# Altium schematic sheet PLL.SchDoc
size B; SheetNumber: 6; SheetTotal: 8
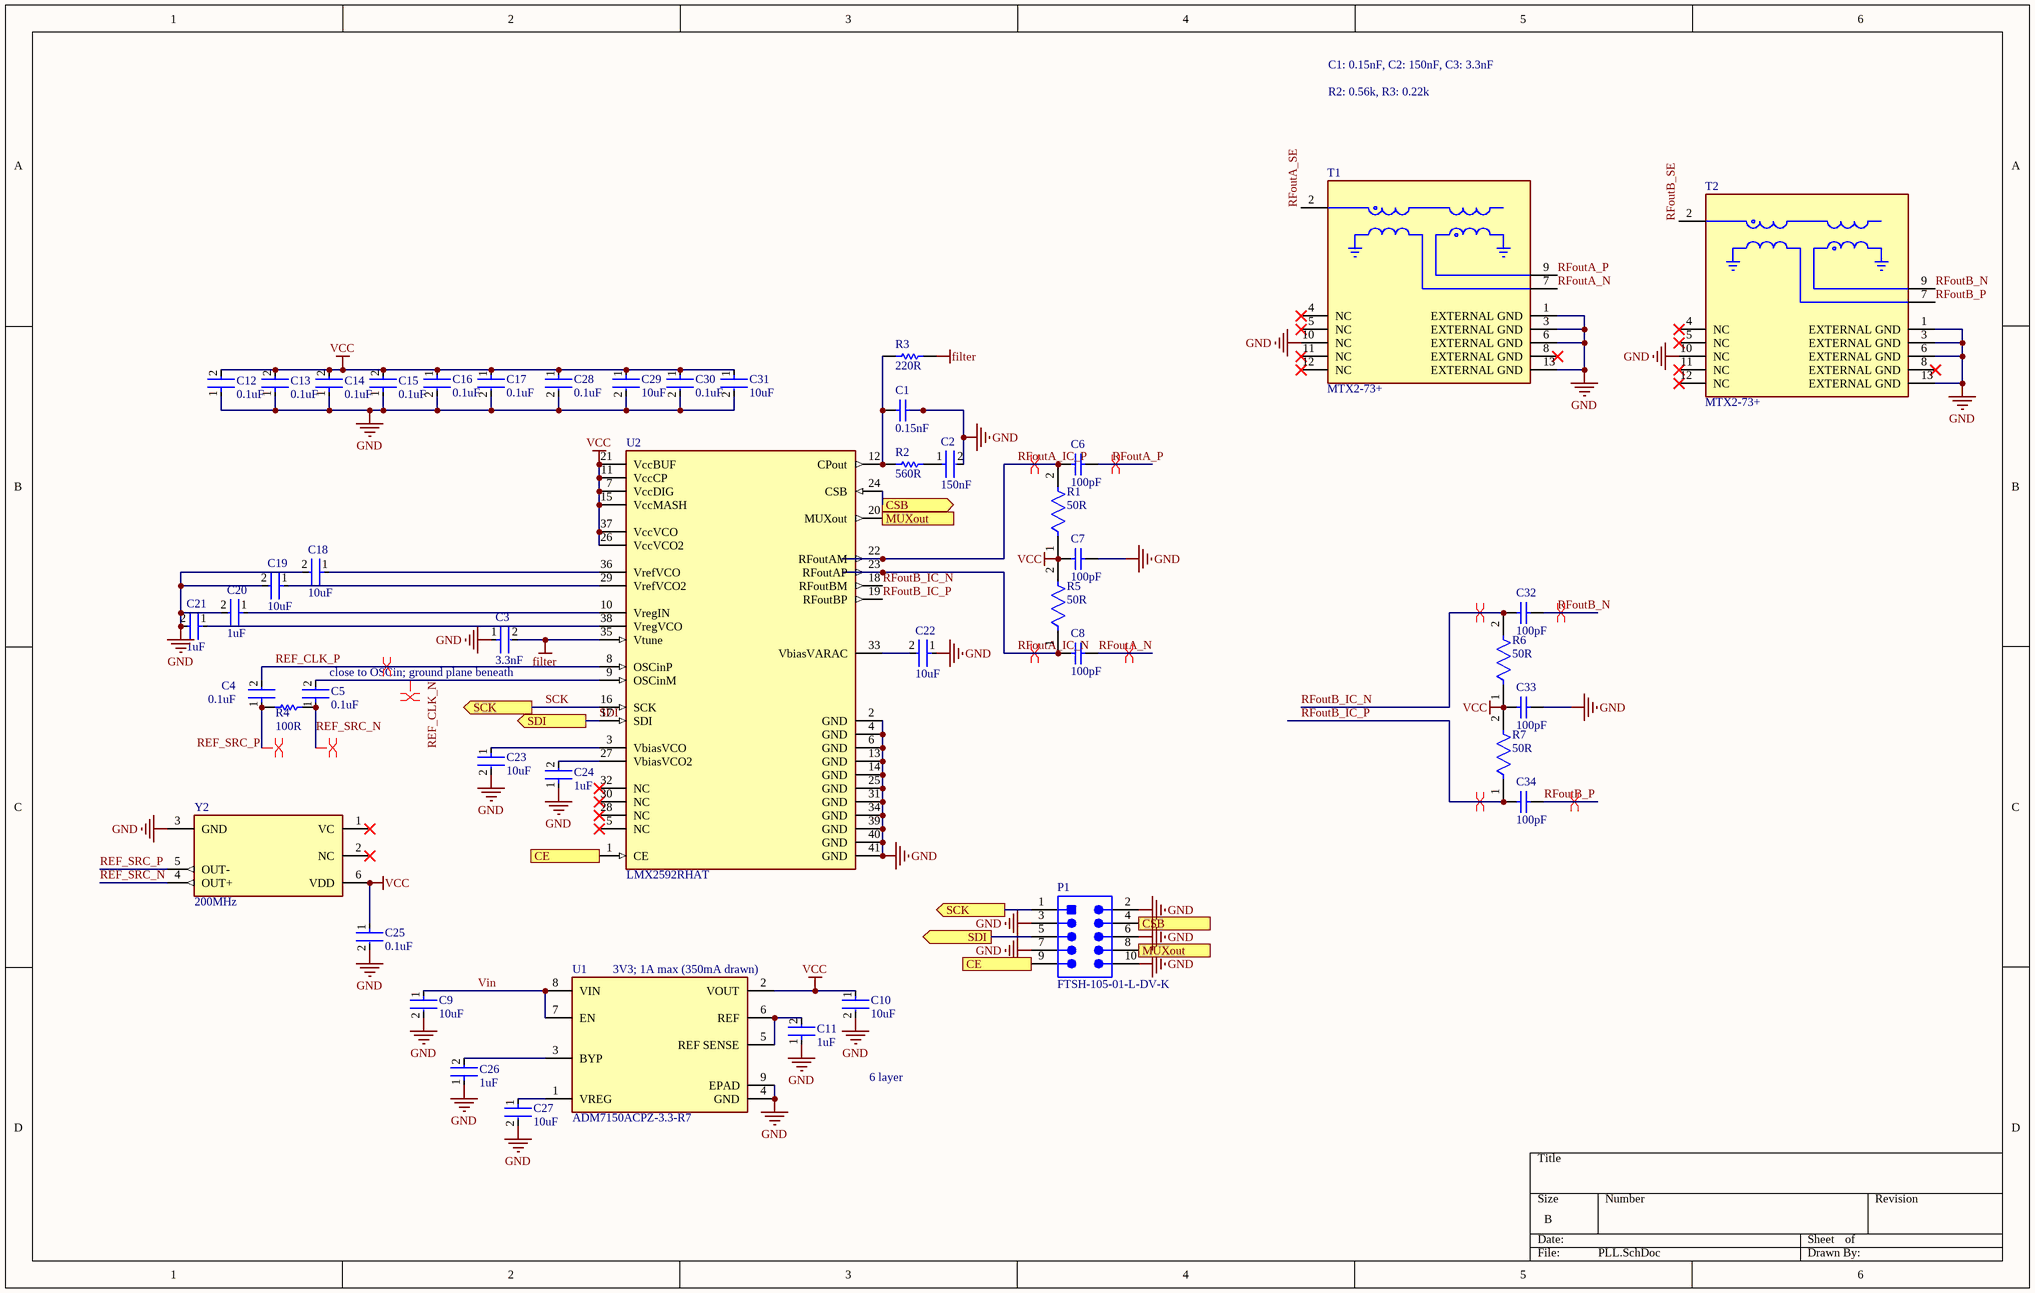
[diagram p0: PLL.SchDoc]

## Parts
C1  0.15nF  [CAPC1608X90X35LL15T15]
C2  150nF  [FP-GRM31C-0_2-e0_3_0_8-IPC_A]
C3  3.3nF  [FP-GCM188-0_1-MFG]
C4  0.1uF  [FP-C0603C-CF-MFG]
C5  0.1uF  [FP-C0603C-CF-MFG]
C6  100pF  [CAPC1608X90X35NL10T15]
C7  100pF  [CAPC1608X90X35NL10T15]
C8  100pF  [CAPC1608X90X35NL10T15]
C9  10uF  [FP-GRM188-0_15-MFG]
C10  10uF  [FP-GRM188-0_15-MFG]
C11  1uF  [FP-0603-L_1_6_0_15-W_0_8-IPC_C]
C12  0.1uF  [FP-C0603C-CF-MFG]
C13  0.1uF  [FP-C0603C-CF-MFG]
C14  0.1uF  [FP-C0603C-CF-MFG]
C15  0.1uF  [FP-C0603C-CF-MFG]
C16  0.1uF  [FP-C0603C-CF-MFG]
C17  0.1uF  [FP-C0603C-CF-MFG]
C18  10uF  [FP-GRM188-0_15-MFG]
C19  10uF  [FP-GRM188-0_15-MFG]
C20  1uF  [FP-0603-L_1_6_0_15-W_0_8-IPC_C]
C21  1uF  [FP-0603-L_1_6_0_15-W_0_8-IPC_C]
C22  10uF  [FP-GRM188-0_15-MFG]
C23  10uF  [FP-GRM188-0_15-MFG]
C24  1uF  [FP-0603-L_1_6_0_15-W_0_8-IPC_C]
C25  0.1uF  [FP-C0603C-CF-MFG]
C26  1uF  [FP-0603-L_1_6_0_15-W_0_8-IPC_C]
C27  10uF  [FP-GRM188-0_15-MFG]
C28  0.1uF  [FP-C0603C-CF-MFG]
C29  10uF  [FP-GRM188-0_15-MFG]
C30  0.1uF  [FP-C0603C-CF-MFG]
C31  10uF  [FP-GRM188-0_15-MFG]
C32  100pF  [CAPC1608X90X35NL10T15]
C33  100pF  [CAPC1608X90X35NL10T15]
C34  100pF  [CAPC1608X90X35NL10T15]
P1  FTSH-105-01-L-DV-K  [SMTC-FTSH-105-01-L-DV-K_V]
R1  50R  [FP-CRCW0603-e3-MFG]
R2  560R  [RESC1608X55X25ML10T15]
R3  220R  [RESC1608X55X25ML10T15]
R4  100R  [RESC1609X50X30ML8T20]
R5  50R  [FP-CRCW0603-e3-MFG]
R6  50R  [FP-CRCW0603-e3-MFG]
R7  50R  [FP-CRCW0603-e3-MFG]
T1  MTX2-73+  [FP-MTX2-73+-MFG]
T2  MTX2-73+  [FP-MTX2-73+-MFG]
U1  ADM7150ACPZ-3.3-R7  [FP-CP-8-11-IPC_C]
U2  LMX2592RHAT  [FP-RHA0040H-IPC_B]
Y2  200MHz  [FP-SiT5021AI-MFG]

## Ports
CE (out), CSB (out), MUXout (out), SCK (out), SDI (out)

## Nets
filter: C3.2 R3.2 U2.35(Vtune)
GND: C1.2 C2.2 C3.1 C7.2 C9.2 C10.2 C11.1 C12.1 C13.1 C14.1 C15.1 C16.2 C17.2 C18.2 C19.2 C20.2 C21.2 C22.1 C23.2 C24.1 C25.2 C26.1 C27.2 C28.2 C29.2 C30.2 C31.2 C33.2 P1.2 P1.3 P1.6 P1.7 P1.10 T1.1(EXTERNAL_GND) T1.3(EXTERNAL_GND) T1.6(EXTERNAL_GND) T1.10(NC) T1.13(EXTERNAL_GND) T2.1(EXTERNAL_GND) T2.3(EXTERNAL_GND) T2.6(EXTERNAL_GND) T2.10(NC) T2.13(EXTERNAL_GND) U1.4(GND) U1.9(EPAD) U2.2(GND) U2.4(GND) U2.6(GND) U2.13(GND) U2.14(GND) U2.25(GND) U2.31(GND) U2.34(GND) U2.39(GND) U2.40(GND) U2.41(GND) Y2.3(GND)
VCC: C7.1 C10.1 C12.2 C13.2 C14.2 C15.2 C16.1 C17.1 C25.1 C28.1 C29.1 C30.1 C31.1 C33.1 R1.1 R5.2 R6.1 R7.2 U1.2(VOUT) U2.7(VccDIG) U2.11(VccCP) U2.15(VccMASH) U2.21(VccBUF) U2.26(VccVCO2) U2.37(VccVCO) Y2.6(VDD)
CE: P1.9 U2.1(CE) ; port CE
CSB: P1.4 U2.24(CSB) ; port CSB
MUXout: P1.8 U2.20(MUXout) ; port MUXout
REF_CLK_N: C5.2 U2.9(OSCinM)
REF_CLK_P: C4.2 U2.8(OSCinP)
REF_SRC_N: C5.1 R4.2 Y2.4(OUT+)
REF_SRC_P: C4.1 R4.1 Y2.5(OUT-)
RFoutA_IC_N: C8.1 R5.1 U2.23(RFoutAP)
RFoutA_IC_P: C6.1 R1.2 U2.22(RFoutAM)
RFoutA_N: C8.2 T1.7(SECONDARY(Balanced))
RFoutA_P: C6.2 T1.9(SECONDARY_DOT(Balanced))
RFoutA_SE: T1.2(PRIMARY_DOT(Unbalanced))
RFoutB_IC_N: C32.1 R6.2 U2.18(RFoutBM)
RFoutB_IC_P: C34.1 R7.1 U2.19(RFoutBP)
RFoutB_N: C32.2 T2.9(SECONDARY_DOT(Balanced))
RFoutB_P: C34.2 T2.7(SECONDARY(Balanced))
RFoutB_SE: T2.2(PRIMARY_DOT(Unbalanced))
SCK: P1.1 U2.16(SCK) ; port SCK
SDI: P1.5 U2.17(SDI) ; port SDI
Vin: C9.1 U1.7(EN) U1.8(VIN)
NetC1_1: C1.1 R2.1 R3.1 U2.12(CPout)
NetC2_1: C2.1 R2.2
NetC11_2: C11.2 U1.5(REF_SENSE) U1.6(REF)
NetC18_1: C18.1 U2.36(VrefVCO)
NetC19_1: C19.1 U2.29(VrefVCO2)
NetC20_1: C20.1 U2.10(VregIN)
NetC21_1: C21.1 U2.38(VregVCO)
NetC22_2: C22.2 U2.33(VbiasVARAC)
NetC23_1: C23.1 U2.3(VbiasVCO)
NetC24_2: C24.2 U2.27(VbiasVCO2)
NetC26_2: C26.2 U1.3(BYP)
NetC27_1: C27.1 U1.1(VREG)

Not connected (* = marked no-connect by the designer): T1 4(NC)* 5(NC)* 8(EXTERNAL_GND)* 11(NC)* 12(NC)*; T2 4(NC)* 5(NC)* 8(EXTERNAL_GND)* 11(NC)* 12(NC)*; U2 5(NC)* 28(NC)* 30(NC)* 32(NC)*; Y2 1(VC)* 2(NC)*

## Layout directives
differential pair: REF_CLK_N, REF_CLK_P, REF_SRC_N, REF_SRC_P, RFoutA_IC_N, RFoutA_IC_P, RFoutA_N, RFoutA_P, RFoutB_IC_N, RFoutB_IC_P, RFoutB_N, RFoutB_P

## Notes on the sheet
- C1: 0.15nF, C2: 150nF, C3: 3.3nF
- R2: 0.56k, R3: 0.22k
- close to OSCin; ground plane beneath
- (near U1) 3V3; 1A max (350mA drawn)
- 6 layer

## Library data of the parts
C1 = CMP-2006-02248-1: Manufacturer: Kemet; Part Number: C0603C151J5GAC7867
C2 = CMP-06035-013092-1: Chip Multilayer Ceramic Capacitors for General Purpose, 1206, 0.15uF, C0G, 30ppm/°C, 5%, 50V
C3 = CMP-06035-044585-1: Ceramic Capacitor for Automotive 3.3nF  ±1% 50VDC C0G 0603 Paper T/R
C4 C5 C12-C17 C25 C28 C30 = CMP-2006-03061-2: CAP CER 0.1UF 50V X7R 0603; Manufacturer: KEMET; Manufacturer Part Number: C0603C104K5RACTU; Tolerance: 0.1; Temperature Coefficient: 30ppm/°C; Material: Ceramic; Automotive Grade: Grade 1; Value: 0.10 μF; Temperature: -55°C to +125°C; RoHS: TRUE; Temperature Range High: +125°C; Lead Free: Yes; Octopart: https://octopart.com/c0603c104k5ractu-kemet-139244; Digikey Description: CAP CER 0.1UF 50V X7R 0603; Category: Cap; Package: C0603C-CF; ComponentLink2Description: Datasheet; Temperature Range Low: -55°C; Device Class L1: Passive Components; Voltage Rating: 50 V; Automotive: Yes; Device Class L3: Ceramic Capacitors; ComponentLink2URL: https://api.kemet.com/component-edge/download/datasheet/C0603C100J5GACAUTO.pdf; Capacitance: 0.10 μF; Device Class L2: Capacitors; Temperature Characteristic: X7R; Height: 0.87mm
C6-C8 C32-C34 = CMP-2006-02595-1: Part Number: GRM1885C1H101JA01D; Manufacturer: Murata
C9 C10 C18 C19 C22 C23 C27 C29 C31 = CMP-06035-003612-1: Chip Multilayer Ceramic Capacitors for General Purpose, 0603, 10uF, X5R, 15%, 20%, 10V; Tolerance: 20%; Dielectric: X5R; Package Quantity: 4000; Width: 0.8mm; Case/Package: 0603; Thickness: 0.035inch; Capacitance: 10uF; Voltage Rating: 10V; Voltage Rating (DC): 10V; Termination: SMD/SMT; Length: 1.6mm; Lead Free: Lead Free; Mount: Surface Mount; Height: 0.8mm; Depth: 0.8mm; Packaging: Tape and Reel; Weight: 0.000222oz; Min Operating Temperature: -55°C; Case Code (Metric): 1608; Max Operating Temperature: 85°C; Case Code (Imperial): 0603; Material: Ceramic
C11 C20 C21 C24 C26 = CMP-2000-07531-4: Ceramic Capacitor General Use 1uF ±10% 50V X7R 0603; Series: M; Width: 0.031inch; Mount: Surface Mount; Radiation Hardening: No; Voltage Rating (DC): 50V; Packaging: Tape and Reel; Termination: SMD/SMT; Depth: 0.8mm; Case Code (Metric): 1608; Case Code (Imperial): 0603; Height: 0.8mm; Voltage Rating: 50V; Package Quantity: 1; Halogen Free: Halogen Free; Dielectric: X7R; Min Operating Temperature: -55°C; Length: 1.6mm; Construction: Flat; Tolerance: 10%; Thickness: 0.037inch; Max Operating Temperature: 125°C; Case/Package: 0603; Capacitance: 1uF; RoHS Compliant: Yes
P1 = CMP-2000-05353-1: Male Header, Pitch 1.27 mm, 2 x 5 Position, Height 6.25 mm; Manufacturer: Samtec; Pitch: 0.050"(1.27mm); Other Names: Q3937619; Number of Positions: 10; Mating Products: SFMC-105-L2-S-D-TR-ND / -CONN.05"SURFACE10POSSMT / FLE-105-01-G-DV-TR-ND / -CONNSKT1.27MM10POSDUALSMD / FLE-105-01-G-DV-A-P-ND / -CONNSKT1.27MM10POSDUALSMD / FLE-105-01-G-DV-A-ND / -CONNSKT1.27MM10POSDUALSMD / CLP-105-02-G-D-P-TR-ND / -CONNRCPT10POSDUAL.05"SMD / SAM1155-05-ND / -CONNRCPT10POSDUAL.05"SMD / SAM1154-05-ND / -CONNRCPT10POSDUAL.05"SMD / SAM1153-05-ND / -CONNRCPT10POSDUAL.05"SMD / SAM1226-05-ND / -CONNRCPT.05"10POSDUALSMD; Number of Positions Loaded: All; Connector Type: Header,Unshrouded; Product Training Modules: Board-to-BoardConnectors; Datasheet Version: Rev. ET, 10/1995; Number of Rows: 2; Standard Package: 1; Package Description: Male Header, Pitch 1.27 mm, 2 x 5 Position, Height 5.97 mm, Tail Length 4.32 mm; Contact Finish Thickness: 10µin(0.25µm); Series: FTSH; Termination: Solder; Contact Type: MalePin; Color: Black; Package Reference: FTSH-105-01-L-DV-K; Family: RectangularConnectors-Headers,MalePins; Package URL: http://suddendocs.samtec.com/prints/ftsh-1xx-xx-xxx-dv-xxx-footprint.pdf; Packaging: Tube; Mounting Type: SurfaceMount; Category: Connectors,Interconnects; Datasheet URL: http://suddendocs.samtec.com/prints/ftsh-1xx-xx-xxx-dv-xxx-mkt.pdf; Row Spacing: 0.050"(1.27mm); Manufacturer URL: http://www.samtec.com/; Contact Mating Length: 0.120"(3.05mm); Contact Finish: Gold
R1 R5-R7 = CMP-2000-03436-2: RES Thick Film, 50Ω, 1%, 0.1W, 100ppm/°C, 0603; Voltage Rating (DC): 75V; Power Rating: 100mW; Case/Package: 0603; Packaging: Tape and Reel; Military Standard: Not; REACH SVHC: No SVHC; Width: 0.85mm; Max Operating Temperature: 155°C; Case Code (Metric): 1608; Temperature Coefficient: 100ppm/°C; Lead Free: Lead Free; Height: 0.45mm; Composition: Thick Film; Termination: SMD/SMT; Contact Plating: Tin; Number of Pins: 2; Tolerance: 1%; Resistance: 50R; Depth: 0.85mm; Weight: 7.1E-05oz; Min Operating Temperature: -55°C; Length: 1.55mm; Radiation Hardening: No; Voltage Rating: 75V; Case Code (Imperial): 0603; Package Quantity: 5000; Mount: Surface Mount
R2 = CMP-1659-00038-1: Chip Resistor, 560 Ohm, +/- 1%, 0.1 W, -55 to 155 degC, 0603 (1608 Metric), RoHS, Tape and Reel; Resistance: 820 Ohm; Case\Package: 0603; Power Rating: 100 mW; Voltage Rating (DC): 50 V; Height: 0.45 mm; Case Code (Metric): 1608; Max Operating Temperature: 155 degC; PackageDescription: 2-Pin Surface Mount Device, Body 1.6 x 0.8 mm; PackageReference: 0603; ComponentLink2Description: Datasheet; ComponentLink1Description: Manufacturer URL; Case Code (Imperial): 0603; Packaging: Tape and Reel; DatasheetVersion: Rev. 4, 02/2016; ComponentLink2URL: http://www.yageo.com/documents/recent/PYu-RC_Group_51_RoHS_L_04.pdf; Length: 1.6 mm; Mount: Surface Mount; Min Operating Temperature: -55 degC; Pins: 2; RoHSCompliant: true; Voltage Rating: 50 V; REACH SVHC: No SVHC; Tolerance: 1%; ComponentLink1URL: http://www.yageo.com/; Width: 0.8 mm
R3 = CMP-1659-00018-2: General Purpose Chip Resistors, 220 Ohm, +/- 1%, -55 to 155 degC, 0603 (1608 Metric), RoHS, Tape and Reel; RoHSCompliant: false; DatasheetVersion: Rev. 4, 04/2009; ComponentLink2Description: Datasheet; ComponentLink2URL: https://datasheet.ciiva.com/11808/0900766b80f96399-11808136.pdf; ComponentLink1URL: http://www.yageo.com/; ComponentLink1Description: Manufacturer URL; PackageReference: 0603; PackageDescription: 2-Pin Surface Mount Device, Body 1.6 x 0.8 mm
R4 = CMP-2000-03824-5: Chip Resistor, 100 Ohm, +/- 1%, 100 mW,-55 to 155 degC, 0603 (1608 Metric), RoHS, Tape and Ree; Manufacturer: Vishay Semiconductor; ComponentLink2URL: http://www.vishay.com/docs/20035/dcrcwe3.pdf; ComponentLink1URL: http://www.vishay.com/; Mounting Technology: Surface Mount; ComponentLink1Description: Manufacturer URL; ComponentLink2Description: Datasheet; PackageDescription: 2-Pin Surface Mount Device, Body 1.575 x 0.85 mm; PackageReference: 0603; DatasheetVersion: 06/2012
T1 T2 = CMP-199822-000008-1: 1:2 MMIC Transformer, 2000 - 7000 MHz, 50Ω; Manufacturer: Mini-Circuits; Return Loss: 6.39dB; Insertion Loss: 1.55-3.37dB; Ipc Land Pattern Name: QFN51P300X300X89-12; Height: 0.039inch; ComponentLink2Description: Datasheet; Package: 0; Automotive: No; Temperature: -40°C to +85°C; Manufacturer Part Number: MTX2-73+; Footprint Url: https://ww2.minicircuits.com/case_style/DQ1225.pdf; Device Class L2: Transformers; Category: Trans; Frequency: 2000-7000MHz; RoHS: TRUE; Device Class L3: unset; ComponentLink2URL: https://www.minicircuits.com/pdfs/MTX2-73+.pdf; Turns Ratio: 1:2; Device Class L1: Passive Components; Lead Free: Yes; Octopart: https://octopart.com/mtx2-73%2B-mini-circuits-107467473; Temperature Range High: +85°C; Temperature Range Low: -40°C
U1 = CMP-09138-000026-1: IC REG LINEAR 3.3V 800MA 8LFCSP; Polarity: Positive; Quiescent Current: 7mA; Output Type: Fixed; Max Input Voltage: 16V; Number of Regulators: 1; Min Current Limit: 1A; Min Input Voltage: 4.5V; Accuracy: 1%; Operating Supply Current: 8.6mA; Power Supply Rejection Ratio (PSRR): -86dB; Packaging: Tape and Reel; RoHS Compliant: Yes; Output Current: 800mA; Output Voltage: 3.3V; Max Operating Temperature: 125°C; Mount: Surface Mount; Number of Outputs: 1; Lead Free: Contains Lead; Contact Plating: Tin; Max Output Current: 800mA; Min Operating Temperature: -40°C; Number of Pins: 8
U2 = CMP-04856-000019-1: IC PLL FREQ SYNTH W/VCO 40VQFN; Input: CMOS; Max Supply Voltage: 3.45V; Operating Supply Voltage: 3.3V; Number of Circuits: 1; Min Supply Voltage: 3.15V; Max Frequency: 9.8GHz; PLL: Yes; Case/Package: VQFN; Max Operating Temperature: 85°C; Mount: Surface Mount; Min Operating Temperature: -40°C; Number of Pins: 40; RoHS Compliant: Yes; REACH SVHC: No SVHC; Packaging: Cut Tape; Frequency: 9.8GHz; Lead Free: Lead Free
Y2 = CMP-25159-261274-1: MEMS OSC VCTCXO 200.0000MHZ LVDS; Frequency Stability: 5ppm; Max Supply Current: 55mA; Case/Package: SMD/SMT; Packaging: Tape and Reel; Min Operating Temperature: -40°C; RoHS Compliant: Yes; Frequency: 200MHz; Mount: Surface Mount; Max Operating Temperature: 85°C